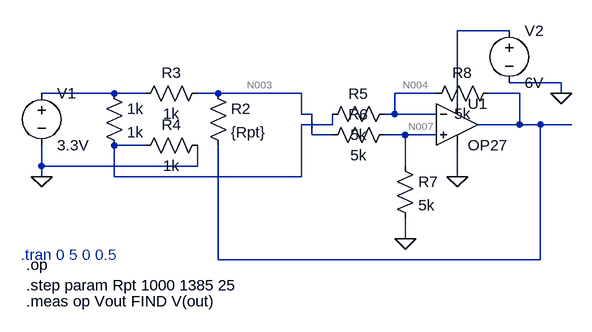
[diagram p0: schematic open bridge.asc]
open bridge.asc, the LTspice schematic file:
Version 4.1
SHEET 1 880 680
WIRE 624 16 544 16
WIRE 704 96 624 96
WIRE 16 112 -96 112
WIRE 64 112 16 112
WIRE 176 112 144 112
WIRE 304 112 176 112
WIRE 512 112 448 112
WIRE 640 112 592 112
WIRE 704 112 704 96
WIRE 544 128 544 16
WIRE 304 144 304 112
WIRE 320 144 304 144
WIRE 448 144 448 112
WIRE 448 144 432 144
WIRE 512 144 448 144
WIRE 352 160 352 144
WIRE 352 160 304 160
WIRE 640 160 640 112
WIRE 640 160 576 160
WIRE 672 160 640 160
WIRE 720 160 672 160
WIRE 320 176 320 144
WIRE 352 176 320 176
WIRE 464 176 432 176
WIRE 512 176 464 176
WIRE 64 192 16 192
WIRE -96 224 -96 192
WIRE 144 224 144 192
WIRE 144 224 -96 224
WIRE 464 224 464 176
WIRE -96 240 -96 224
WIRE 16 240 16 192
WIRE 304 240 304 160
WIRE 304 240 16 240
WIRE 544 240 544 192
WIRE 464 336 464 304
WIRE 176 368 176 192
WIRE 672 368 672 160
WIRE 672 368 176 368
FLAG -96 240 0
FLAG 464 336 0
FLAG 544 240 0
FLAG 704 112 0
SYMBOL res 0 96 R0
SYMATTR InstName 1k
SYMATTR Value 1k
SYMBOL res 160 96 R0
SYMATTR InstName R2
SYMATTR Value {Rpt}
SYMBOL res 160 96 R90
WINDOW 0 0 56 VBottom 2
WINDOW 3 32 56 VTop 2
SYMATTR InstName R3
SYMATTR Value 1k
SYMBOL res 160 176 R90
WINDOW 0 0 56 VBottom 2
WINDOW 3 32 56 VTop 2
SYMATTR InstName R4
SYMATTR Value 1k
SYMBOL voltage -96 96 R0
WINDOW 123 0 0 Left 0
WINDOW 39 0 0 Left 0
SYMATTR InstName V1
SYMATTR Value 3.3V
SYMBOL OpAmps\\OP27 544 96 R0
SYMATTR InstName U1
SYMBOL res 448 128 R90
WINDOW 0 0 56 VBottom 2
WINDOW 3 32 56 VTop 2
SYMATTR InstName R5
SYMATTR Value 5k
SYMBOL res 448 160 R90
WINDOW 0 0 56 VBottom 2
WINDOW 3 32 56 VTop 2
SYMATTR InstName R6
SYMATTR Value 5k
SYMBOL res 448 208 R0
SYMATTR InstName R7
SYMATTR Value 5k
SYMBOL res 608 96 R90
WINDOW 0 0 56 VBottom 2
WINDOW 3 32 56 VTop 2
SYMATTR InstName R8
SYMATTR Value 5k
SYMBOL voltage 624 0 R0
WINDOW 123 0 0 Left 0
WINDOW 39 0 0 Left 0
SYMATTR InstName V2
SYMATTR Value 6V
TEXT -128 360 Left 2 ;.tran 0 5 0 0.5
TEXT -120 376 Left 2 !.op\n.step param Rpt 1000 1385 25
TEXT -120 432 Left 2 !.meas op Vout FIND V(out)

The netlist it stands for:
* open bridge.asc
R§1k N002 N006 1k
R2 N003 N005 {Rpt}
R3 N003 N002 1k
R4 0 N006 1k
V1 N002 0 3.3V
X§U1 N007 N004 N001 0 N005 OP27  ; pins In+ In- V+ V- OUT
R5 N004 N006 5k
R6 N007 N003 5k
R7 N007 0 5k
R8 N005 N004 5k
V2 N001 0 6V
* .tran 0 5 0 0.5
.op
.step param Rpt 1000 1385 25
.meas op Vout FIND V(out)
.lib ADI.lib
.backanno
.end

* Results of the author's LTspice run, read from the files saved beside the schematic
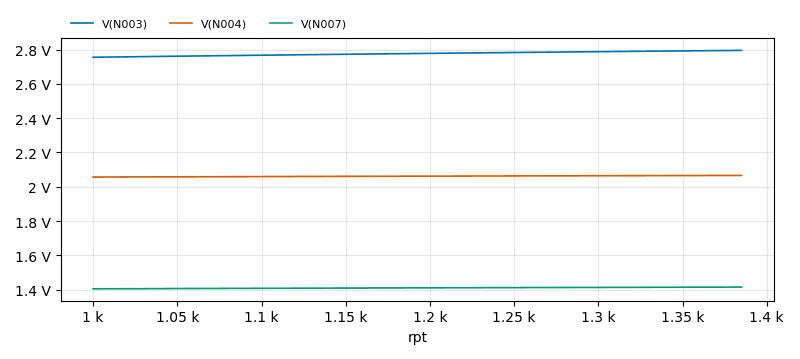
[diagram p1: Operating Point of open bridge.asc, plotted from the saved traces]
* Operating Point, 1 run:
*   V(N003): 2.755 V at rpt=1 k, 2.795 V at rpt=1.385 k, min 2.755 V, max 2.795 V
*   V(N004): 2.056 V at rpt=1 k, 2.066 V at rpt=1.385 k, min 2.056 V, max 2.066 V
*   V(N007): 1.405 V at rpt=1 k, 1.415 V at rpt=1.385 k, min 1.405 V, max 1.415 V